# Altium schematic sheet MOSFET_Section.SchDoc
size A; SheetNumber: 5; SheetTotal: 7
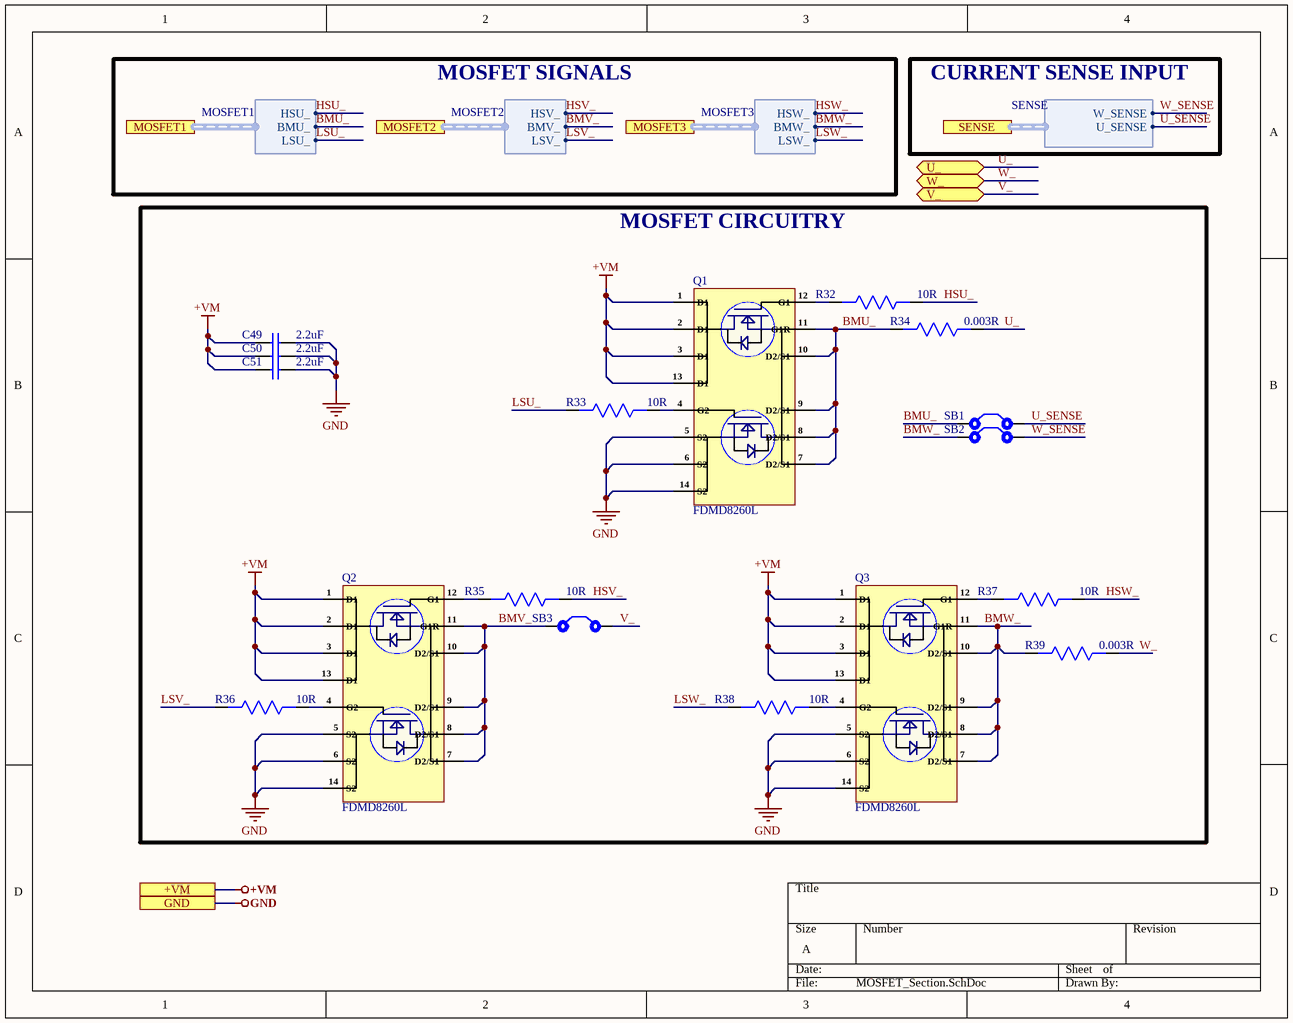
[diagram p0: MOSFET_Section.SchDoc]

## Parts
C49  2.2uF  [Cap0805]
C50  2.2uF  [Cap0805]
C51  2.2uF  [Cap0805]
Q1  FDMD8260L  [12-Power3.3x5]
Q2  FDMD8260L  [12-Power3.3x5]
Q3  FDMD8260L  [12-Power3.3x5]
R32  10R  [Res0603]
R33  10R  [Res0603]
R34  0.003R  [RES 2512]
R35  10R  [Res0603]
R36  10R  [Res0603]
R37  10R  [Res0603]
R38  10R  [Res0603]
R39  0.003R  [RES 2512]
SB1  Solder Bridge  [Solder Bridge]  (value not drawn)
SB2  Solder Bridge  [Solder Bridge]  (value not drawn)
SB3  Solder Bridge  [Solder Bridge]  (value not drawn)

## Blocks framed on the sheet
MOSFET CIRCUITRY: C49-C51 Q1-Q3 R32-R39 SB1-SB3

## Ports
+VM, GND, MOSFET1 (harness MOSFET1), MOSFET2 (harness MOSFET2), MOSFET3 (harness MOSFET3), SENSE (harness SENSE), U_ (bidir), V_ (bidir), W_ (bidir)

## Harnesses
MOSFET1: HSU_, BMU_, LSU_
MOSFET2: HSV_, BMV_, LSV_
MOSFET3: HSW_, BMW_, LSW_
SENSE: W_SENSE, U_SENSE

## Nets
+VM: C49.1 C50.1 C51.1 Q1.1(D1) Q1.2(D1) Q1.3(D1) Q1.13(D1) Q2.1(D1) Q2.2(D1) Q2.3(D1) Q2.13(D1) Q3.1(D1) Q3.2(D1) Q3.3(D1) Q3.13(D1) ; port +VM
GND: C49.2 C50.2 C51.2 Q1.5(S2) Q1.6(S2) Q1.14(S2) Q2.5(S2) Q2.6(S2) Q2.14(S2) Q3.5(S2) Q3.6(S2) Q3.14(S2) ; port GND
BMU_: Q1.7(D2/S1) Q1.8(D2/S1) Q1.9(D2/S1) Q1.10(D2/S1) Q1.11(G1R) R34.2 SB1.1 ; port MOSFET1.BMU_
BMV_: Q2.7(D2/S1) Q2.8(D2/S1) Q2.9(D2/S1) Q2.10(D2/S1) Q2.11(G1R) SB3.1 ; port MOSFET2.BMV_
BMW_: Q3.7(D2/S1) Q3.8(D2/S1) Q3.9(D2/S1) Q3.10(D2/S1) Q3.11(G1R) R39.2 SB2.1 ; port MOSFET3.BMW_
HSU_: R32.1 ; port MOSFET1.HSU_
HSV_: R35.1 ; port MOSFET2.HSV_
HSW_: R37.1 ; port MOSFET3.HSW_
LSU_: R33.2 ; port MOSFET1.LSU_
LSV_: R36.2 ; port MOSFET2.LSV_
LSW_: R38.2 ; port MOSFET3.LSW_
U_: R34.1 ; port U_
U_SENSE: SB1.2 ; port SENSE.U_SENSE
V_: SB3.2 ; port V_
W_: R39.1 ; port W_
W_SENSE: SB2.2 ; port SENSE.W_SENSE
NetQ1_4: Q1.4(G2) R33.1
NetQ1_12: Q1.12(G1) R32.2
NetQ2_4: Q2.4(G2) R36.1
NetQ2_12: Q2.12(G1) R35.2
NetQ3_4: Q3.4(G2) R38.1
NetQ3_12: Q3.12(G1) R37.2

## Notes on the sheet
- MOSFET SIGNALS
- CURRENT SENSE INPUT

## Library data of the parts
C49-C51 = GRM21BD72A225KE01L: CAP CER 2.2UF 100V X7T 0805; Manufacturer: Murata; Supplier 1: Digi-Key; Manufacturer Part Number: GRM21BD72A225KE01L; RoHS: No; Category: Ceramic Capacitors; Stock 1: 1904; Pricing 1: 1=0.57000, 10=0.40200, 50=0.30360, 100=0.26450, 500=0.19592, 1000=0.16654 (USD); RoHS Compliant: Yes; Supplier Part Number 1: 490-GRM21BD72A225KE01LCT-ND
Q1-Q3 = FDMD8260L: MOSFET 2N-CH 60V 15A 12POWER; Manufacturer: ON Semiconductor / Fairchild; Rds On Max: 5.8mR; Input Capacitance: 5.245nF; Max Power Dissipation: 1W; Element Configuration: Dual; FET Type: 2 N-Channel; Supplier 1: Newark; Manufacturer Part Number: FDMD8260L; RoHS: Yes; Category: MOSFETs; Pricing 1: 1=3.19000, 10=2.87000, 25=2.72000, 50=2.54000, 100=2.35000, 250=2.18000, 500=2.01000, 1000=1.76000 (USD); Mount: Surface Mount; Number of Pins: 12; Weight: 0.0823188g; Min Operating Temperature: -55°C; Max Operating Temperature: 150°C; Packaging: Tape and Reel; Drain to Source Voltage (Vdss): 60V; Continuous Drain Current (ID): 15A; RoHS Compliant: Yes; ComponentLink1URL: https://www.fairchildsemi.com/datasheets/FD/FDMD8260L.pdf?src-supplier=Digi-Key; ComponentLink1Description: https://www.fairchildsemi.com/datasheets/FD/FDMD8260L.pdf?src-supplier=Digi-Key; Supplier Part Number 1: 54AH8638
R32 R33 R35-R38 = RC0603FR-0710RL: RES SMD 10 OHM 1% 1/10W 0603; Manufacturer: Yageo; Temperature Coefficient: 200ppm/°C; Power Rating: 100mW; Voltage Rating: 50V; Supplier 1: Digi-Key; Manufacturer Part Number: RC0603FR-0710RL; Stock 1: 10836596; Pricing 1: 1=0.1, 10=0.046, 100=0.0187, 1000=0.0084, 2500=0.00729 (USD); Case/Package: 0603; Number of Pins: 2; Case Code (Imperial): 0603; Case Code (Metric): 1608; Contact Plating: Tin,Matte; Min Operating Temperature: -55°C; Max Operating Temperature: 155°C; Resistance: 10R; Tolerance: 1%; Composition: Thick Film; Packaging: Tape and Reel; Voltage Rating (DC): 50V; Termination: SMD/SMT; Military Standard: Not; Length: 1.6mm; Height: 0.45mm; Width: 0.8mm; Depth: 0.8mm; Radiation Hardening: No; Lead Free: Lead Free; REACH SVHC: No SVHC; ComponentLink1URL: http://www.farnell.com/datasheets/1868787.pdf?src-supplier=Element14; ComponentLink1Description: http://www.farnell.com/datasheets/1868787.pdf?src-supplier=Element14; ComponentLink2URL: http://www.yageo.com/documents/recent/PYu-RC0603_51_RoHS_L_4.pdf?src-supplier=Avnet; ComponentLink2Description: http://www.yageo.com/documents/recent/PYu-RC0603_51_RoHS_L_4.pdf?src-supplier=Avnet; ComponentLink3URL: http://documents.rs-components.com/techlib://itc_doclist_GB.htm?stockno=5048984&src-supplier=RSComponents; ComponentLink3Description: http://documents.rs-components.com/techlib://itc_doclist_GB.htm?stockno=5048984&src-supplier=RSComponents; ComponentLink4URL: http://www.yageo.com/documents/recent/PYu-RC0603_51_RoHS_L_4.pdf?src-supplier=Avnet+Europe; ComponentLink4Description: http://www.yageo.com/documents/recent/PYu-RC0603_51_RoHS_L_4.pdf?src-supplier=Avnet+Europe; Supplier Part Number 1: 311-10.0HRDKR-ND
R34 R39 = CRE2512-FZ-R003E-3: RES 0.003 OHM 1% 3W 2512; Manufacturer: Bourns; Temperature Coefficient: 75ppm/°C; Resistance: 3mR; Supplier 1: Arrow Electronics; Manufacturer Part Number: CRE2512-FZ-R003E-3; RoHS: No; Category: Chip SMD Resistors; Stock 1: 7276; Pricing 1: 1=0.51890, 10=0.41630, 25=0.38400, 100=0.30630, 250=0.29870, 500=0.29120, 1000=0.28360, 3000=0.27600, 6000=0.26850 (USD); Mount: Surface Mount; Case/Package: 2512; Case Code (Imperial): 2512; Case Code (Metric): 6432; Contact Plating: Tin; Min Operating Temperature: -55°C; Max Operating Temperature: 170°C; Features: Moisture Resistant,Automotive AEC-Q200; Resistor Type: Metal Film,Metal Alloy,Thick Film; Number of Terminations: 2; Termination: Solder; Max Power Dissipation: 3W; Power Rating: 3W; Tolerance: 1%; Packaging: Cut Tape; Length: 0.254inch; Width: 0.132inch; Height: 0.035inch; Depth: 3.35mm; REACH SVHC: No SVHC; ComponentLink1URL: https://datasheet.ciiva.com/46424/1838634-46424792.pdf?src-supplier=Element14; ComponentLink1Description: https://datasheet.ciiva.com/46424/1838634-46424792.pdf?src-supplier=Element14; ComponentLink2URL: https://datasheet.ciiva.com/46424/1838634-46424793.pdf?src-supplier=Element14; ComponentLink2Description: https://datasheet.ciiva.com/46424/1838634-46424793.pdf?src-supplier=Element14; ComponentLink3URL: https://datasheet.ciiva.com/48532/cre-48532221.pdf?src-supplier=Avnet; ComponentLink3Description: https://datasheet.ciiva.com/48532/cre-48532221.pdf?src-supplier=Avnet; Supplier Part Number 1: CRE2512-FZ-R003E-3
SB1-SB3 = Solder Bridge: Solder Bridge ON